# EasyEDA Pro project ProPrj_Codex_key_2026-10-20_10-08-15_2026-11-04.epro, schematic KeyboardSchematic1

## Sheets
1 P1: Assembly Variant: Basic; Board Name: Board1; Create Date: 2026-10-20; Page Name: P1; Project Name: Codex_key_2026-10-20_10-08-15; Schematic Name: Schematic1; Update Date: 2026-10-20; Company: 嘉立创EDA; Page Size: A4; Version: V1.0
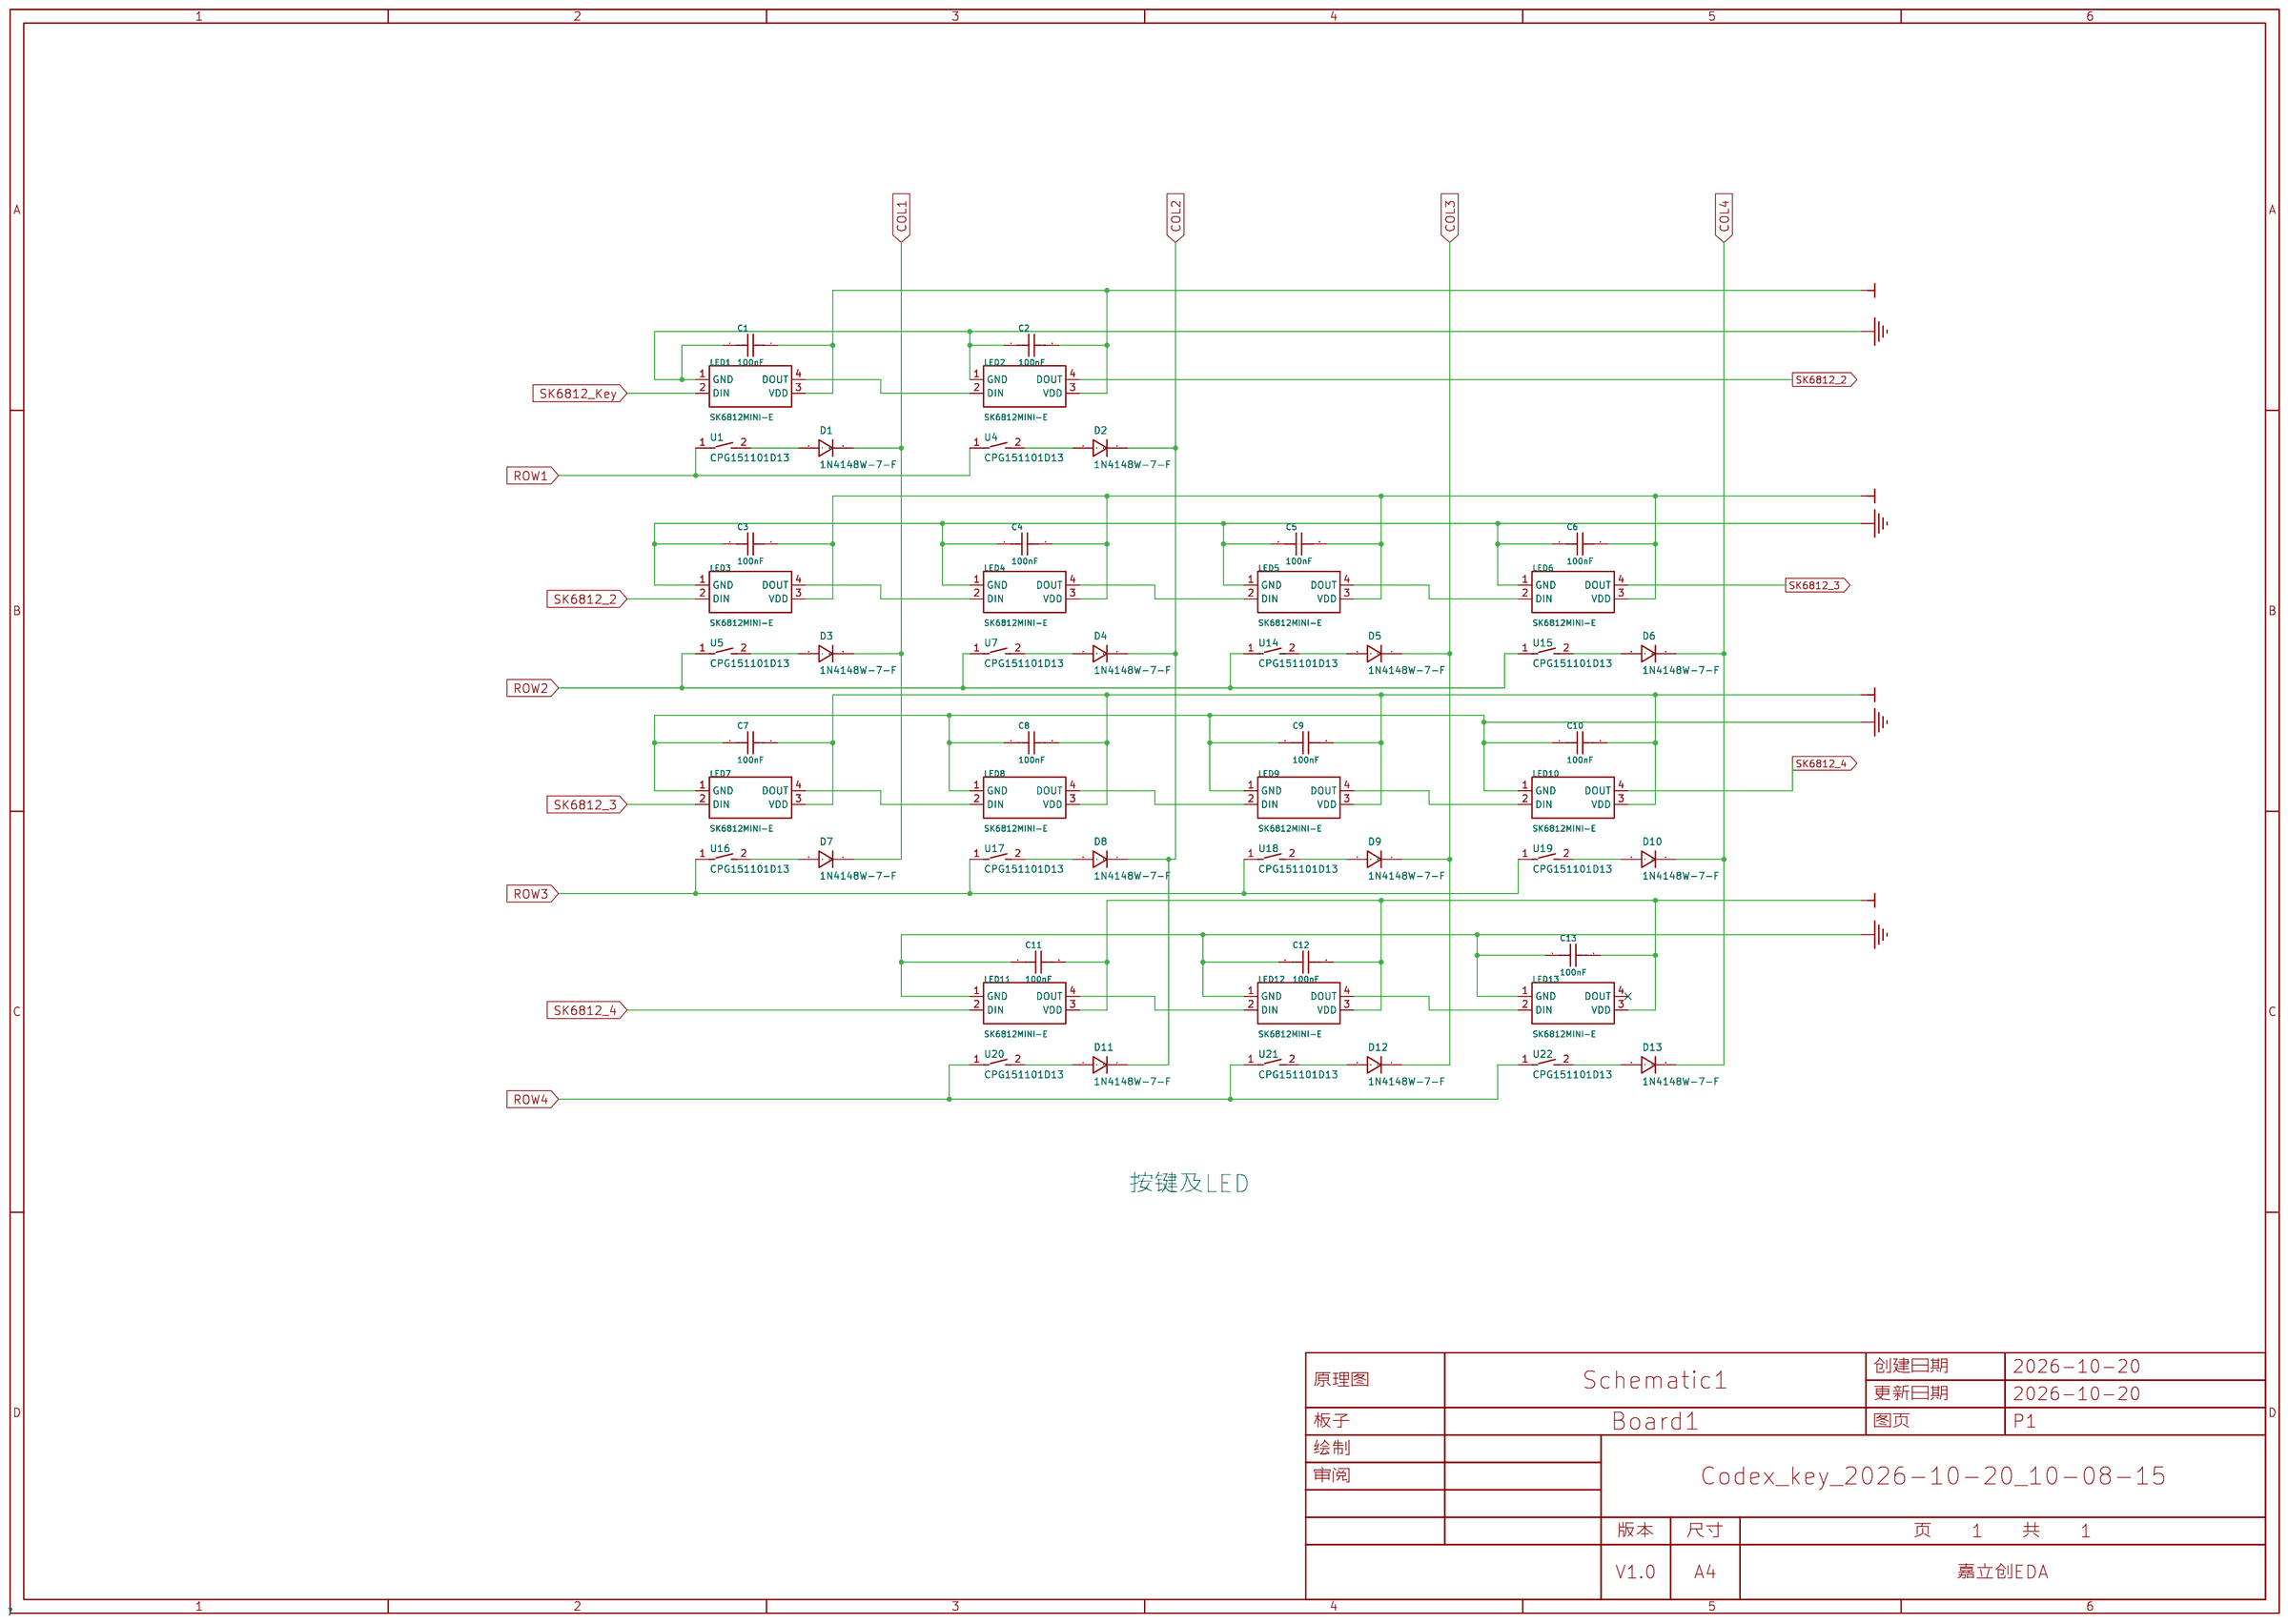
[diagram p0: P1]
2 P2: Page Name: P2
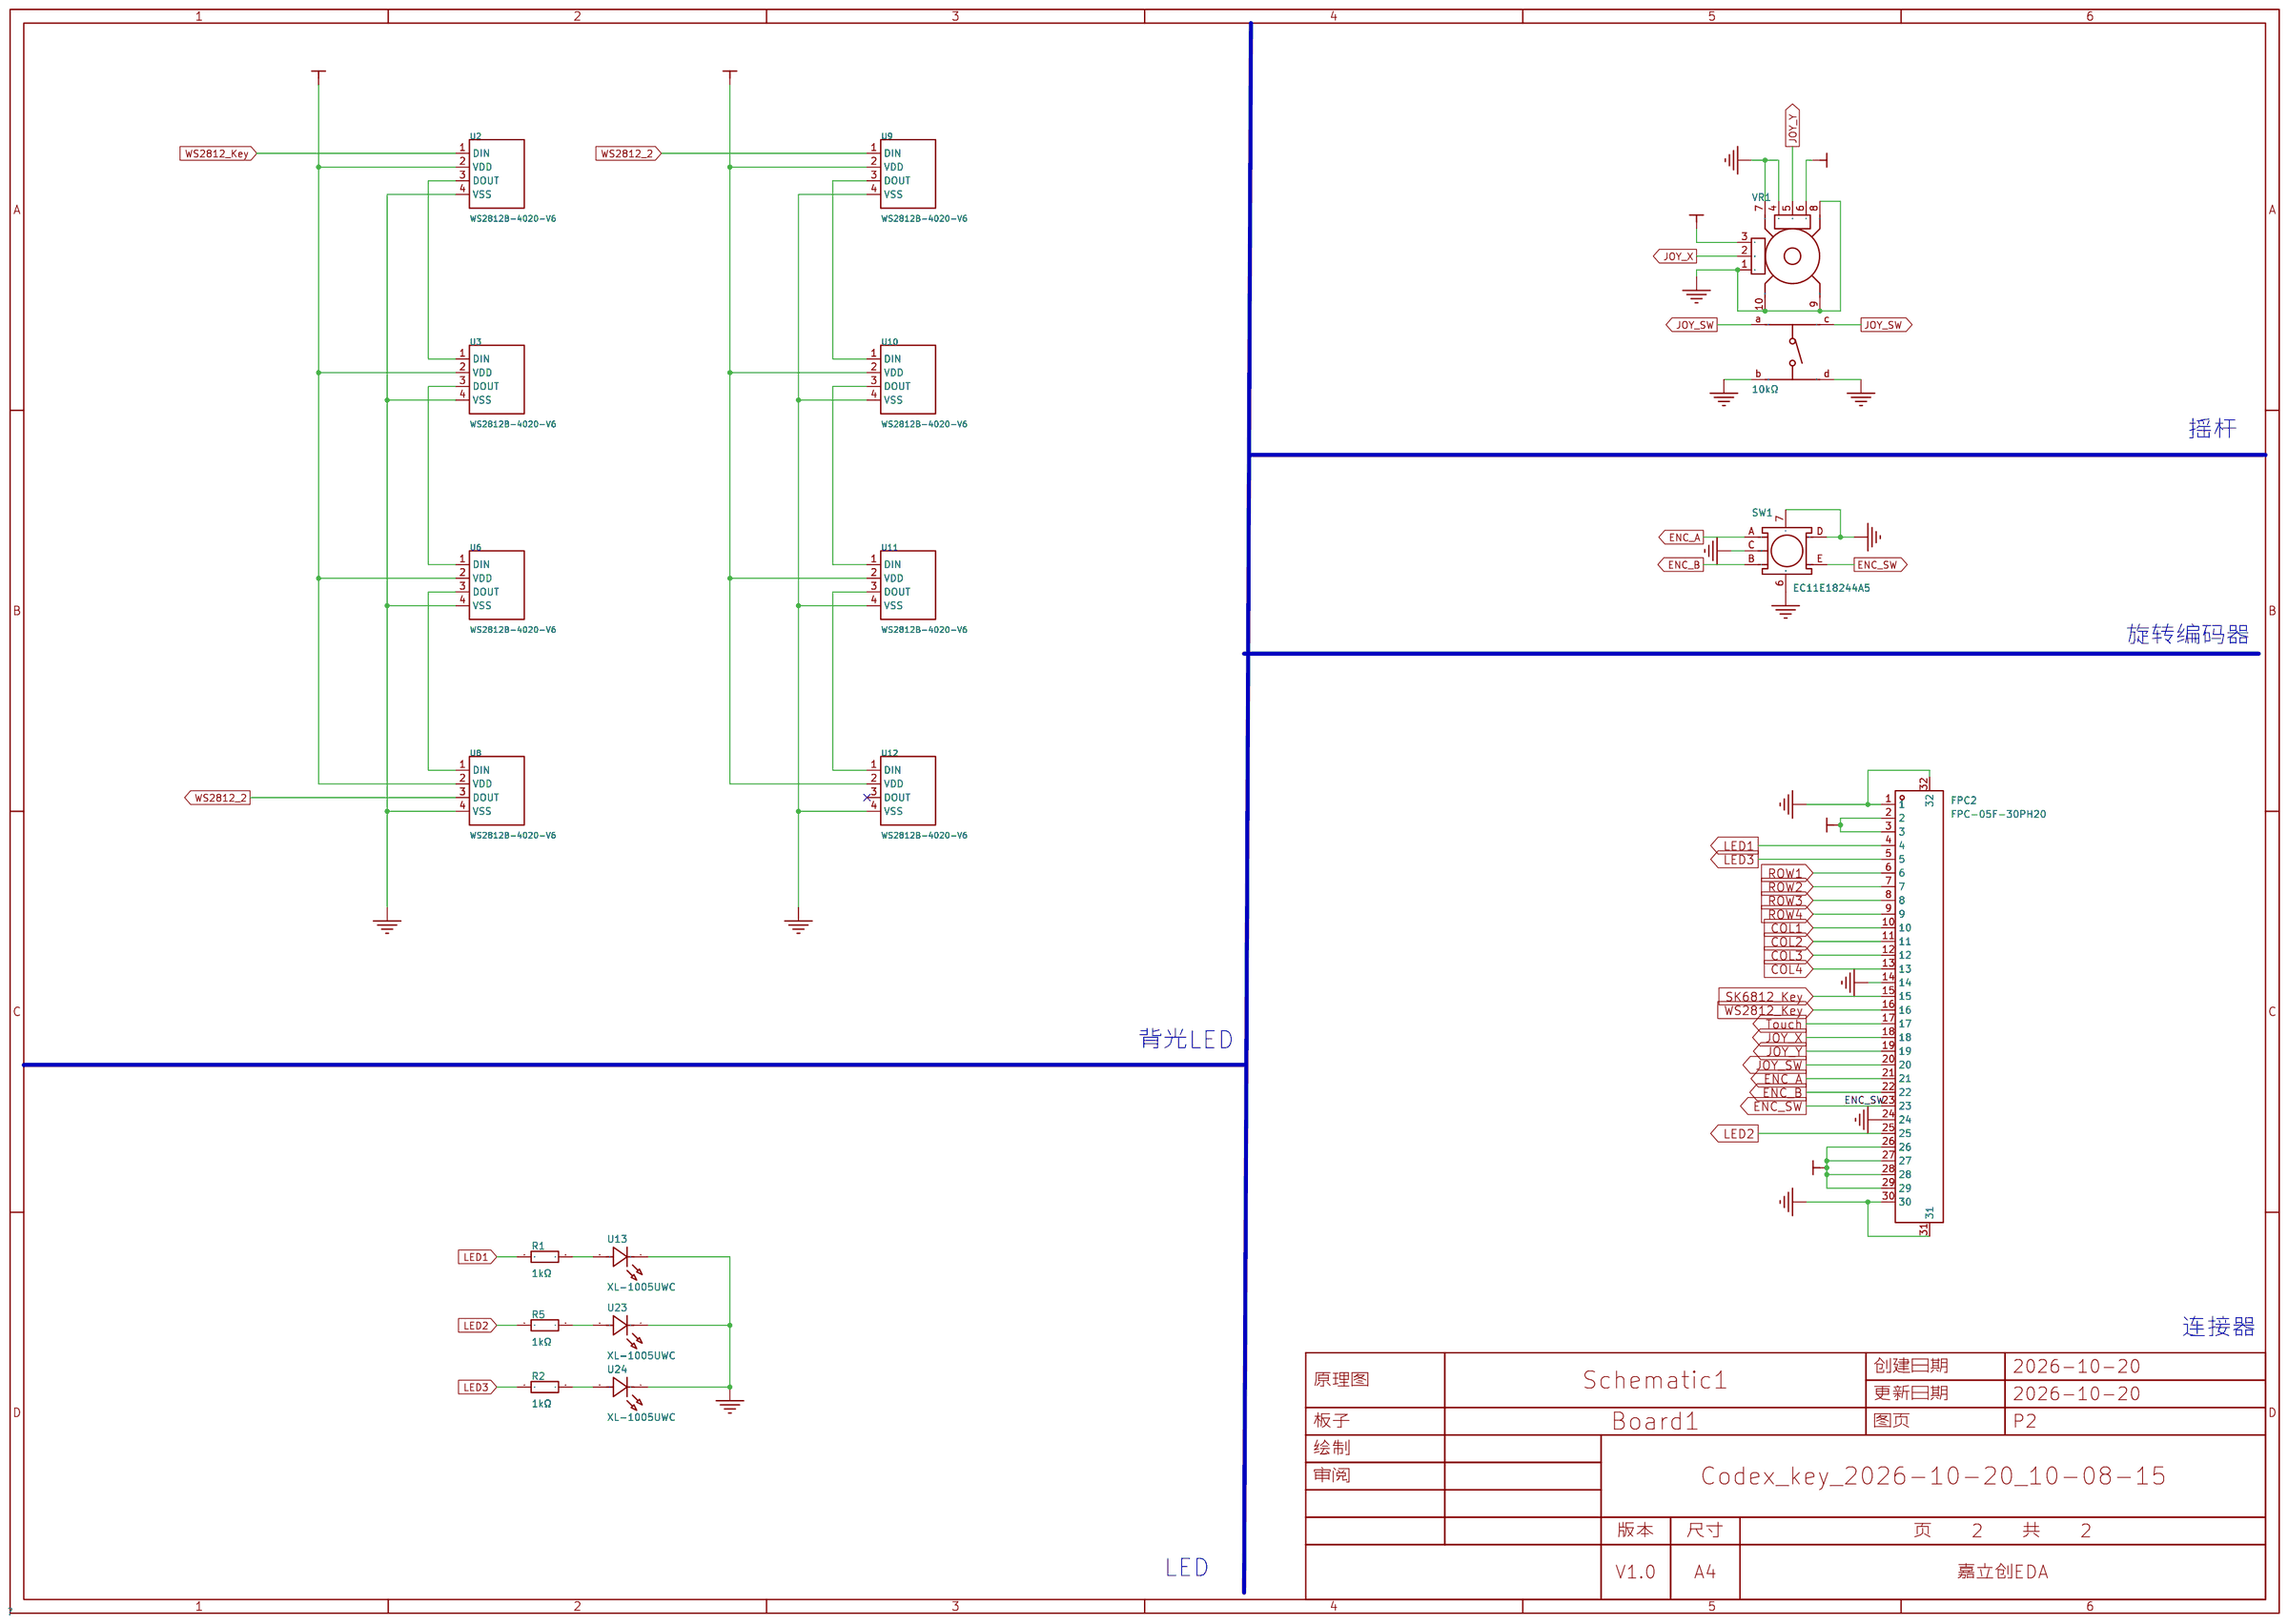
[diagram p1: P2]

## Parts
sheet P1
C1  100nF  [C0603]
C2  100nF  [C0603]
C3  100nF  [C0603]
C4  100nF  [C0603]
C5  100nF  [C0603]
C6  100nF  [C0603]
C7  100nF  [C0603]
C8  100nF  [C0603]
C9  100nF  [C0603]
C10  100nF  [C0603]
C11  100nF  [C0603]
C12  100nF  [C0603]
C13  100nF  [C0603]
D1  1N4148W-7-F  [SOD-123_L2.7-W1.6-LS3.7-RD-1]
D2  1N4148W-7-F  [SOD-123_L2.7-W1.6-LS3.7-RD-1]
D3  1N4148W-7-F  [SOD-123_L2.7-W1.6-LS3.7-RD-1]
D4  1N4148W-7-F  [SOD-123_L2.7-W1.6-LS3.7-RD-1]
D5  1N4148W-7-F  [SOD-123_L2.7-W1.6-LS3.7-RD-1]
D6  1N4148W-7-F  [SOD-123_L2.7-W1.6-LS3.7-RD-1]
D7  1N4148W-7-F  [SOD-123_L2.7-W1.6-LS3.7-RD-1]
D8  1N4148W-7-F  [SOD-123_L2.7-W1.6-LS3.7-RD-1]
D9  1N4148W-7-F  [SOD-123_L2.7-W1.6-LS3.7-RD-1]
D10  1N4148W-7-F  [SOD-123_L2.7-W1.6-LS3.7-RD-1]
D11  1N4148W-7-F  [SOD-123_L2.7-W1.6-LS3.7-RD-1]
D12  1N4148W-7-F  [SOD-123_L2.7-W1.6-LS3.7-RD-1]
D13  1N4148W-7-F  [SOD-123_L2.7-W1.6-LS3.7-RD-1]
LED1  SK6812MINI-E  [LED-SMD_4P-L3.2-W2.8-LS5.9_SK6812MINI-E]
LED2  SK6812MINI-E  [LED-SMD_4P-L3.2-W2.8-LS5.9_SK6812MINI-E]
LED3  SK6812MINI-E  [LED-SMD_4P-L3.2-W2.8-LS5.9_SK6812MINI-E]
LED4  SK6812MINI-E  [LED-SMD_4P-L3.2-W2.8-LS5.9_SK6812MINI-E]
LED5  SK6812MINI-E  [LED-SMD_4P-L3.2-W2.8-LS5.9_SK6812MINI-E]
LED6  SK6812MINI-E  [LED-SMD_4P-L3.2-W2.8-LS5.9_SK6812MINI-E]
LED7  SK6812MINI-E  [LED-SMD_4P-L3.2-W2.8-LS5.9_SK6812MINI-E]
LED8  SK6812MINI-E  [LED-SMD_4P-L3.2-W2.8-LS5.9_SK6812MINI-E]
LED9  SK6812MINI-E  [LED-SMD_4P-L3.2-W2.8-LS5.9_SK6812MINI-E]
LED10  SK6812MINI-E  [LED-SMD_4P-L3.2-W2.8-LS5.9_SK6812MINI-E]
LED11  SK6812MINI-E  [LED-SMD_4P-L3.2-W2.8-LS5.9_SK6812MINI-E]
LED12  SK6812MINI-E  [LED-SMD_4P-L3.2-W2.8-LS5.9_SK6812MINI-E]
LED13  SK6812MINI-E  [LED-SMD_4P-L3.2-W2.8-LS5.9_SK6812MINI-E]
U1  CPG151101D13  [KEY-TH_CPG151101D21X]
U4  CPG151101D13  [KEY-TH_CPG151101D21X]
U5  CPG151101D13  [KEY-TH_CPG151101D21X]
U7  CPG151101D13  [KEY-TH_CPG151101D21X]
U14  CPG151101D13  [KEY-TH_CPG151101D21X]
U15  CPG151101D13  [KEY-TH_CPG151101D21X]
U16  CPG151101D13  [KEY-TH_CPG151101D21X]
U17  CPG151101D13  [KEY-TH_CPG151101D21X]
U18  CPG151101D13  [KEY-TH_CPG151101D21X]
U19  CPG151101D13  [KEY-TH_CPG151101D21X]
U20  CPG151101D13  [KEY-TH_CPG151101D21X]
U21  CPG151101D13  [KEY-TH_CPG151101D21X]
U22  CPG151101D13  [KEY-TH_CPG151101D21X]
sheet P2
FPC2  FPC-05F-30PH20  [FPC-SMD_30P-P0.50_XUNPU_FPC-05F-30PH20]
R1  1kΩ  [R0402]
R2  1kΩ  [R0402]
R5  1kΩ  [R0402]
SW1  EC11E18244A5  [SW-TH_EC11E18244A5]
U2  WS2812B-4020-V6  [LED-SMD_4P-L4.0-W1.7_DCS-CA4020A0R02G02B02CE004]
U3  WS2812B-4020-V6  [LED-SMD_4P-L4.0-W1.7_DCS-CA4020A0R02G02B02CE004]
U6  WS2812B-4020-V6  [LED-SMD_4P-L4.0-W1.7_DCS-CA4020A0R02G02B02CE004]
U8  WS2812B-4020-V6  [LED-SMD_4P-L4.0-W1.7_DCS-CA4020A0R02G02B02CE004]
U9  WS2812B-4020-V6  [LED-SMD_4P-L4.0-W1.7_DCS-CA4020A0R02G02B02CE004]
U10  WS2812B-4020-V6  [LED-SMD_4P-L4.0-W1.7_DCS-CA4020A0R02G02B02CE004]
U11  WS2812B-4020-V6  [LED-SMD_4P-L4.0-W1.7_DCS-CA4020A0R02G02B02CE004]
U12  WS2812B-4020-V6  [LED-SMD_4P-L4.0-W1.7_DCS-CA4020A0R02G02B02CE004]
U13  XL-1005UWC  [LED0402-RD_YELLOW]
U23  XL-1005UWC  [LED0402-RD_YELLOW]
U24  XL-1005UWC  [LED0402-RD_YELLOW]
VR1  10kΩ  [SW-TH_RKJXV1224005]

## Library data of the parts
C1-C13 = CC0603KRX7R9BB104: 容值:100nF;精度:±10%;额定电压:50V;温度系数:X7R;; LCSC Part Name: 100nF ±10% 50V; Supplier Part: C14663; Manufacturer: YAGEO(国巨); Supplier Footprint: 0603; JLCPCB Part Class: Basic Part; Datasheet: https://item.szlcsc.com/datasheet/CC0603KRX7R9BB104/15331.html; Supplier: LCSC; Tolerance: ±10%; Voltage Rating: 50V; Temperature Coefficient: X7R
D1-D13 = 1N4148W-7-F: 二极管配置:独立式;整流电流:300mA;直流反向耐压(Vr):100V;正向压降(Vf):1.25V@150mA;反向恢复时间(Trr):4ns;; LCSC Part Name: 100V 300mA; Supplier Part: C83528; Manufacturer: DIODES(美台); Supplier Footprint: SOD-123; JLCPCB Part Class: Extended Part; Datasheet: https://item.szlcsc.com/datasheet/1N4148W-7-F/84693.html; Supplier: LCSC; Diode Configuration: 独立式; Pd - Power Dissipation: 400mW; Current - Rectified: 300mA; Voltage - DC Reverse(Vr): 100V; Voltage - Forward(Vf@If): 1.25V@150mA; Non-Repetitive Peak Forward Surge Current: 2A; Reverse Leakage Current (Ir): 1uA@75V; Reverse Recovery Time (trr): 4ns; Operating Junction Temperature Range: -65℃~+150℃
LED1-LED13 = SK6812MINI-E_C5149201: 工作电压：5 V @ 12 mA (OUT GRB)； 发光角度：120°； 胶体颜色：半透明； 内置复位电路，上电不亮灯； 灰度调节：256级； 单线归零码传输协议，可无限级联； 数据传输频率可达800Kbps， 当刷新速率30帧/秒时，级联数不小于1024点； 湿敏等级：5a； 静电ESD：2KV； 符合RoHS REACH。; LCSC Part Name: 工作电压5V、发光角度120°、灰度调节256级的RGB LED; Supplier Part: C5149201; Manufacturer: OPSCO(欧思科); Supplier Footprint: SMD; JLCPCB Part Class: Extended Part; Datasheet: https://item.szlcsc.com/datasheet/SK6812MINI-E/5773397.html; Supplier: LCSC; Dominant Wavelength - R: 620nm~625nm; Dominant Wavelength - G: 515nm~525nm; Dominant Wavelength - B: 460nm~470nm; Data Transmission Rate: 800Kbit/s; Voltage - Supply: 3.7V~5.5V; Quiescent Current: 0.6mA; Lens Color: 半透明透镜; ESD Withstand Voltage: 2000V; Operating Temperature: -40℃~+85℃; Fixed-Frequency Pwm Mode: 1kHz; Viewing Angle: 120°; Length: 3.2mm; Width: 1.78mm; Height: 2.8mm; Luminous Intensity - R: 160mcd~320mcd; Luminous Intensity - G: 815mcd~1275mcd; Luminous Intensity - B: 120mcd~240mcd
U1 U4 U5 U7 U14-U22 = CPG151101D13: 轴类型:青轴;作用力:50gf;; LCSC Part Name: 青轴; Supplier Part: C49234235; Manufacturer: HanElectricity(瀚源); Supplier Footprint: 插件; JLCPCB Part Class: Extended Part; Datasheet: https://item.szlcsc.com/datasheet/CPG151101D13/51650377.html; Supplier: LCSC; Axis Type: 青轴; Operation Force: 50gf; Conduction Travel: 2.2mm; Voltage Rating: 12V; Operating Temperature: -40℃~+70℃
FPC2 = FPC-05F-30PH20: 锁定特性:翻盖式;触点类型:下接;触点数量:30P;间距:0.5mm;安装方式:卧贴;工作温度:-25℃~+85℃;; LCSC Part Name: 翻盖式 下接 P数:30P 间距:0.5mm; Supplier Part: C2856808; Manufacturer: XUNPU(讯普); Supplier Footprint: SMD,P=0.5mm,卧贴; JLCPCB Part Class: Extended Part; Datasheet: https://item.szlcsc.com/datasheet/FPC-05F-30PH20/3056906.html; Supplier: LCSC; Locking Feature: 翻盖式; Contact Type: 下接; Number of Contacts: 30P; Pitch: 0.5mm; Mounting Type: 卧贴; FFC, FCB Thickness: 0.3mm; Height Above Board: 2mm; Contact Material: 磷青铜; Contact Plating: 锡; Operating Temperature: -25℃~+85℃; Rated Voltage (Max): 50V; Current Rating (Max): 500mA
R1 R2 R5 = 0402WGF1001TCE: 电阻类型:厚膜电阻;阻值:1kΩ;精度:±1%;功率:62.5mW;最大工作电压:50V;温度系数:±100ppm/℃;; LCSC Part Name: 1kΩ ±1% 62.5mW 厚膜电阻; Supplier Part: C11702; Manufacturer: UNI-ROYAL(厚声); Supplier Footprint: 0402; JLCPCB Part Class: 基础库; Datasheet: https://atta.szlcsc.com/upload/public/pdf/source/20200306/C422600_1E6D84923E4A46A82E41ADD87F860B5C.pdf; Supplier: LCSC; Type: 厚膜电阻; Tolerance: ±1%; Power(Watts): 62.5mW; Overload Voltage (Max): 50V; Temperature Coefficient: ±100ppm/℃; Operating Temperature Range: -55℃~+155℃
SW1 = EC11E18244A5: LCSC Part Name: 11mm尺寸金属轴类型; Supplier Part: C255515; Manufacturer: ALPSALPINE(阿尔卑斯阿尔派); Supplier Footprint: 插件; JLCPCB Part Class: Extended Part; Datasheet: https://item.szlcsc.com/datasheet/EC11E18244A5/249470.html; Supplier: LCSC; Encoder Type: 增量式; Number of Detents / Pulses (Incremental): 36/18; Output Form: 两相输出; Whether to Press Down: 支持; Shaft Reset: 自复位; Mounting Type: 直插; Current Rating (Max): 10mA; Rated Voltage (Max): 5V; Operating Temperature: -40℃~+85℃
U2 U3 U6 U8-U12 = WS2812B-4020-V6: WS2812B-4020升级版本，侧发光，不分方向，DIN/DOUT自由互换，任意拼接，超低静态功耗，3.3V完全恒流，上电零闪，EMC和控制信号再升级; LCSC Part Name: 智能外控集成LED光源，控制电路与RGB芯片集成，内置信号整形和复位电路，支持单线归零码通讯，光颜色高度一致; Supplier Part: C52941387; Manufacturer: worldsemi; Supplier Footprint: SMD-4P,4x2mm; JLCPCB Part Class: Extended Part; Datasheet: https://item.szlcsc.com/datasheet/WS2812B-4020-V6/55856750.html; Supplier: LCSC; Dominant Wavelength - R: 620nm~625nm; Dominant Wavelength - G: 515nm~525nm; Dominant Wavelength - B: 465nm~475nm; Data Transmission Rate: 800Kbit/s; Voltage - Supply: 3.3V~5.3V; Quiescent Current: 1uA; Operating Temperature: -40℃~+85℃; Fixed-Frequency Pwm Mode: 2kHz; Length: 3.98mm; Width: 2mm; Height: 1.7mm; Features: 内置上电复位电路；集成智能反向连接保护功能；内置掉电复位电路; Luminous Intensity - R: 300mcd~500mcd; Luminous Intensity - G: 600mcd~1000mcd; Luminous Intensity - B: 200mcd~300mcd; Transmission Delay: 300ns; Fall Time: 120us
U13 U23 U24 = XL-1005UWC_C20613596: 灯头类型:1.0mmx0.5mm方形灯头;发光颜色:白色;正向压降(Vf):2.8V;功率:75mW;正向电流:5mA;波长:-;二极管配置:独立二极管;透镜颜色:黄色透镜;色温:15000K;发光强度:1cd;发光角度:120°;载带方式:正贴;工作温度:-40℃~+85℃;; LCSC Part Name: 0402冷白光贴片式发光二极管; Supplier Part: C20613596; Manufacturer: XINGLIGHT(成兴光); Supplier Footprint: 0402; JLCPCB Part Class: Extended Part; Datasheet: https://item.szlcsc.com/datasheet/XL-1005UWC/21979587.html; Supplier: LCSC; Lamp Holder Type: 1.0mmx0.5mm方形灯头; Illumination Color: 白色; Voltage - Forward(Vf): 2.8V; Power(Watts): 75mW; Forward Current: 5mA; Diode Configuration: 独立二极管; Lens Color: 黄色透镜; Color Temperature: 15000K; Luminous Intensity: 1cd; Viewing Angle: 120°; Mounting Style: 正贴; Operating Temperature: -40℃~+85℃
VR1 = RKJXV122400R: 阻值:10kΩ;精度:±5%;功率:125mW;; LCSC Part Name: 10kΩ ±5%; Supplier Part: C918854; Manufacturer: ALPSALPINE(阿尔卑斯阿尔派); Supplier Footprint: 插件; JLCPCB Part Class: Extended Part; Datasheet: https://item.szlcsc.com/datasheet/RKJXV122400R/995767.html; Supplier: LCSC; Tolerance: ±5%; Voltage Rating: 5V; Power(Watts): 125mW

## Nets
+5V: C1.2 C2.2 C3.2 C4.2 C5.2 C6.2 C7.2 C8.2 C9.2 C10.2 C11.2 C12.2 C13.2 FPC2.26 FPC2.27 FPC2.28 FPC2.29 LED1.3(VDD) LED2.3(VDD) LED3.3(VDD) LED4.3(VDD) LED5.3(VDD) LED6.3(VDD) LED7.3(VDD) LED8.3(VDD) LED9.3(VDD) LED10.3(VDD) LED11.3(VDD) LED12.3(VDD) LED13.3(VDD) U2.2(VDD) U3.2(VDD) U6.2(VDD) U8.2(VDD) U9.2(VDD) U10.2(VDD) U11.2(VDD) U12.2(VDD)
GND: C1.1 C2.1 C3.1 C4.1 C5.1 C6.1 C7.1 C8.1 C9.1 C10.1 C11.1 C12.1 C13.1 FPC2.1 FPC2.14 FPC2.24 FPC2.30 FPC2.31 FPC2.32 LED1.1(GND) LED2.1(GND) LED3.1(GND) LED4.1(GND) LED5.1(GND) LED6.1(GND) LED7.1(GND) LED8.1(GND) LED9.1(GND) LED10.1(GND) LED11.1(GND) LED12.1(GND) LED13.1(GND) SW1.6 SW1.7 SW1.C SW1.D U2.4(VSS) U3.4(VSS) U6.4(VSS) U8.4(VSS) U9.4(VSS) U10.4(VSS) U11.4(VSS) U12.4(VSS) U13.1(K) U23.1(K) U24.1(K) VR1.1(B) VR1.4(A) VR1.7(GND) VR1.8(GND) VR1.9(GND) VR1.10(GND) VR1.b VR1.d
VCC: FPC2.2 FPC2.3 VR1.3(A) VR1.6(B)
COL1: D1.1(C) D3.1(C) D7.1(C) FPC2.10
COL2: D2.1(C) D4.1(C) D8.1(C) D11.1(C) FPC2.11
COL3: D5.1(C) D9.1(C) D12.1(C) FPC2.12
COL4: D6.1(C) D10.1(C) D13.1(C) FPC2.13
ENC_A: FPC2.21 SW1.A
ENC_B: FPC2.22 SW1.B
ENC_SW: FPC2.23 SW1.E
JOY_SW: FPC2.20 VR1.a VR1.c
JOY_X: FPC2.18 VR1.2(DTA)
JOY_Y: FPC2.19 VR1.5(DTA)
LED1: FPC2.4 R1.1
LED2: FPC2.25 R5.1
LED3: FPC2.5 R2.1
ROW1: FPC2.6 U1.1 U4.1
ROW2: FPC2.7 U5.1 U7.1 U14.1 U15.1
ROW3: FPC2.8 U16.1 U17.1 U18.1 U19.1
ROW4: FPC2.9 U20.1 U21.1 U22.1
SK6812_2: LED2.4(DOUT) LED3.2(DIN)
SK6812_3: LED6.4(DOUT) LED7.2(DIN)
SK6812_4: LED10.4(DOUT) LED11.2(DIN)
SK6812_Key: FPC2.15 LED1.2(DIN)
Touch: FPC2.17
WS2812_2: U8.3(DOUT) U9.1(DIN)
WS2812_Key: FPC2.16 U2.1(DIN)
$1N6: D1.2(A) U1.2
$1N8: D2.2(A) U4.2
$1N12: LED1.4(DOUT) LED2.2(DIN)
$1N14: D3.2(A) U5.2
$1N16: D4.2(A) U7.2
$1N18: D5.2(A) U14.2
$1N25: D9.2(A) U18.2
$1N26: D10.2(A) U19.2
$1N28: D7.2(A) U16.2
$1N33: D13.2(A) U22.2
$1N35: D12.2(A) U21.2
$1N36: D11.2(A) U20.2
$1N54: D6.2(A) U15.2
$1N58: D8.2(A) U17.2
$1N65: LED3.4(DOUT) LED4.2(DIN)
$1N67: LED4.4(DOUT) LED5.2(DIN)
$1N68: LED5.4(DOUT) LED6.2(DIN)
$1N77: LED7.4(DOUT) LED8.2(DIN)
$1N78: LED8.4(DOUT) LED9.2(DIN)
$1N79: LED9.4(DOUT) LED10.2(DIN)
$1N85: LED11.4(DOUT) LED12.2(DIN)
$1N86: LED12.4(DOUT) LED13.2(DIN)
$2N311: U2.3(DOUT) U3.1(DIN)
$2N312: U3.3(DOUT) U6.1(DIN)
$2N313: U6.3(DOUT) U8.1(DIN)
$2N318: U9.3(DOUT) U10.1(DIN)
$2N319: U10.3(DOUT) U11.1(DIN)
$2N320: U11.3(DOUT) U12.1(DIN)
$2N387: R1.2 U13.2(A)
$2N390: R5.2 U23.2(A)
$2N391: R2.2 U24.2(A)

Not connected (* = marked no-connect by the designer): LED13 4(DOUT)*; U12 3(DOUT)*

## Notes on the sheets
sheet 1
- 按键及LED
sheet 2
- 摇杆
- 旋转编码器
- 背光LED
- 连接器
- LED
